# Altium schematic sheet 05_60_HOST_UART.SchDoc
size 289 x 396 mm
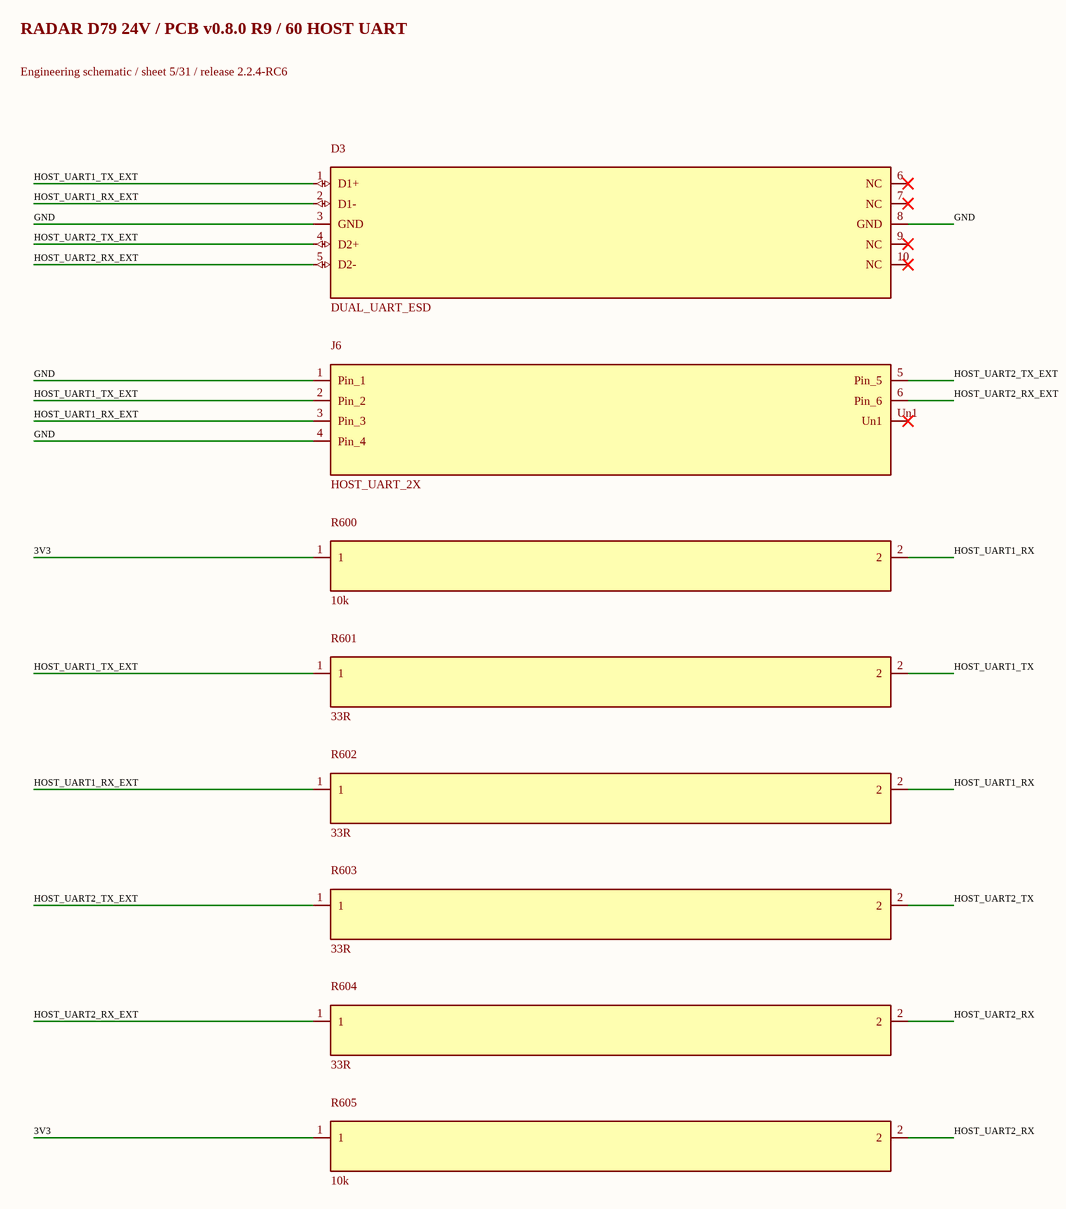
[diagram p0: 05_60_HOST_UART.SchDoc]

## Parts
D3  DUAL_UART_ESD  [USON-10_2.5x1.0mm_P0.5mm]
J6  HOST_UART_2X  [Molex_43045-0600_RA_THT_6P]
R600  10k  [R_0603_1608Metric]
R601  33R  [R_0402_1005Metric]
R602  33R  [R_0402_1005Metric]
R603  33R  [R_0402_1005Metric]
R604  33R  [R_0402_1005Metric]
R605  10k  [R_0603_1608Metric]

## Nets
3V3: R600.1 R605.1
GND: D3.3(GND) D3.8(GND) J6.1(Pin_1) J6.4(Pin_4)
HOST_UART1_RX: R600.2 R602.2
HOST_UART1_RX_EXT: D3.2(D1-) J6.3(Pin_3) R602.1
HOST_UART1_TX: R601.2
HOST_UART1_TX_EXT: D3.1(D1+) J6.2(Pin_2) R601.1
HOST_UART2_RX: R604.2 R605.2
HOST_UART2_RX_EXT: D3.5(D2-) J6.6(Pin_6) R604.1
HOST_UART2_TX: R603.2
HOST_UART2_TX_EXT: D3.4(D2+) J6.5(Pin_5) R603.1

Not connected (* = marked no-connect by the designer): D3 6(NC)* 7(NC)* 9(NC)* 10(NC)*; J6 Un1*

## Notes on the sheet
- RADAR D79 24V / PCB v0.8.0 R9 / 60 HOST UART
- Engineering schematic / sheet 5/31 / release 2.2.4-RC6